# Altium schematic sheet Connector_Section.SchDoc
size A4; DocumentNumber: 5; SheetNumber: 5; SheetTotal: 5
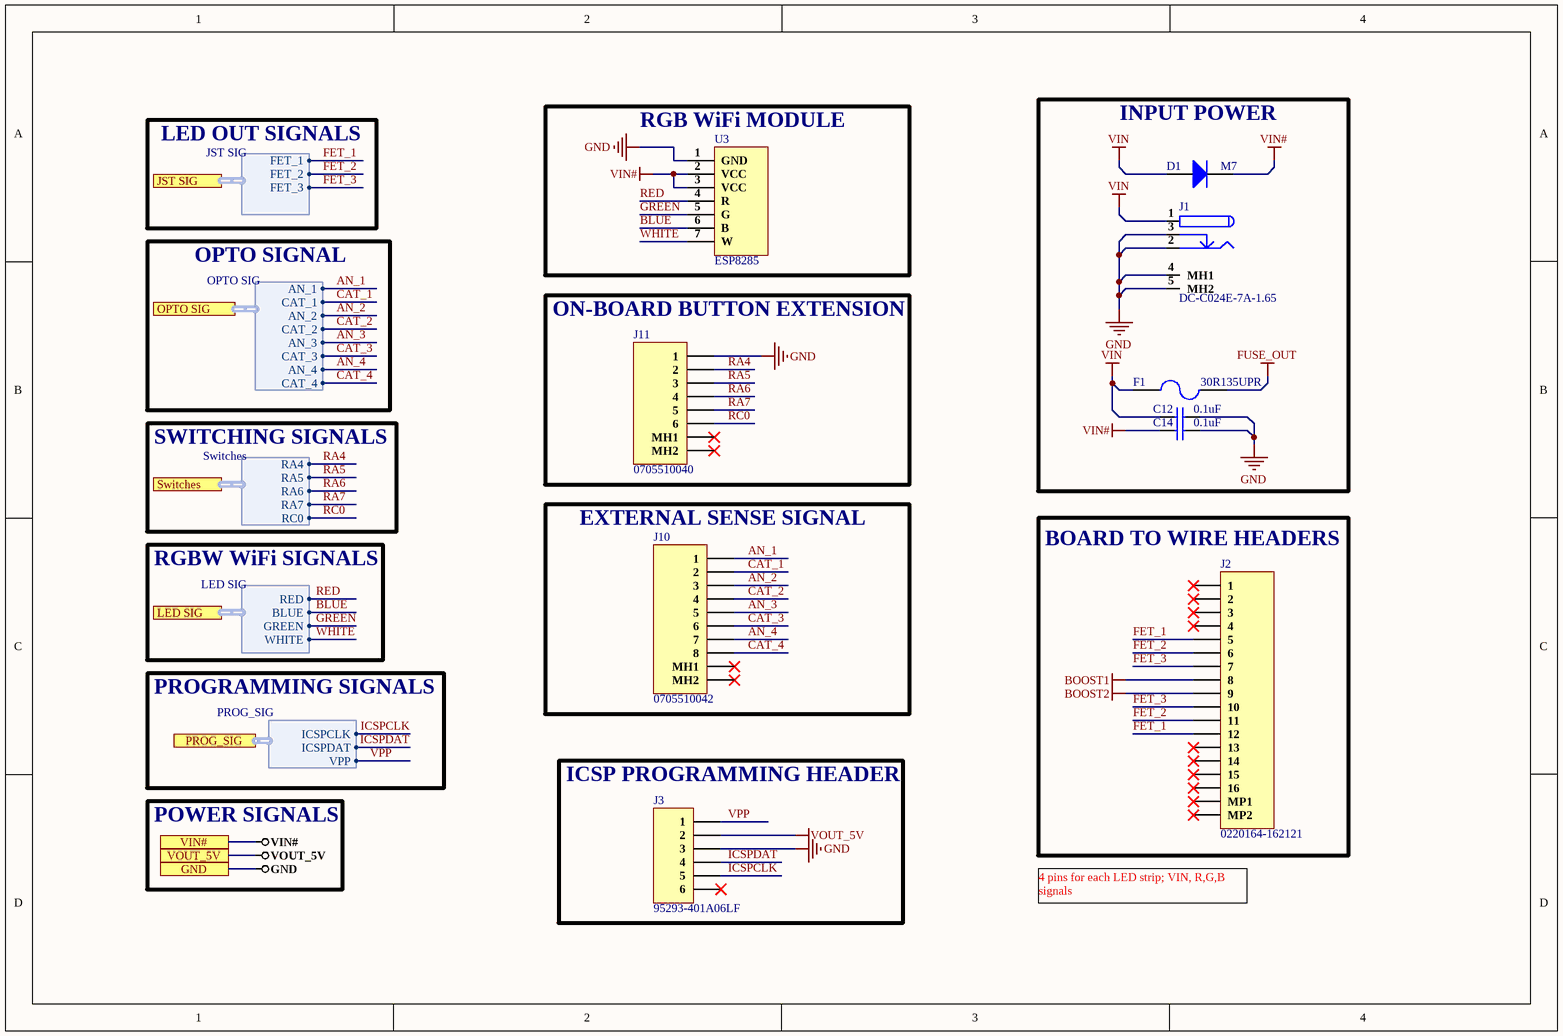
[diagram p0: Connector_Section.SchDoc]

## Parts
C12  0.1uF  [Cap0402]
C14  0.1uF  [Cap0402]
D1  M7  [SMA]
F1  30R135UPR  [30R135UPR]
J1  DC-C024E-7A-1.65  [DC-C024E-7A-1.65]
J2  0220164-162121  [0220164-162121]
J3  95293-401A06LF  [95293-401A06LF]
J10  0705510042  [0705510042]
J11  0705510040  [0705510040]
U3  ESP8285  [ESP8285]

## Blocks framed on the sheet
RGB WiFi MODULE: U3
INPUT POWER: C12 C14 D1 F1 J1
ON-BOARD BUTTON EXTENSION: J11
EXTERNAL SENSE SIGNAL: J10
BOARD TO WIRE HEADERS: J2
ICSP PROGRAMMING HEADER: J3

## Ports
GND, JST SIG (harness JST SIG), LED SIG (harness LED SIG), OPTO SIG (harness OPTO SIG), PROG_SIG (harness PROG_SIG), Switches (harness Switches), VIN#, VOUT_5V

## Harnesses
PROG_SIG: ICSPCLK, ICSPDAT, VPP
LED SIG: RED, BLUE, GREEN, WHITE
Switches: RA4, RA5, RA6, RA7, RC0
OPTO SIG: AN_1, CAT_1, AN_2, AN_3, AN_4, CAT_2, CAT_3, CAT_4
JST SIG: FET_1, FET_2, FET_3

## Nets
BOOST1: J2.8
BOOST2: J2.9
FUSE_OUT: F1.2
GND: C12.2 C14.2 J1.2 J1.3 J1.4(MH1) J1.5(MH2) J3.3 J11.1 U3.1(GND) ; port GND
VIN: C12.1 D1.1(A) F1.1 J1.1
VIN#: C14.1 D1.2(K) U3.2(VCC) U3.3(VCC) ; port VIN#
VOUT_5V: J3.2 ; port VOUT_5V
AN_1: J10.1 ; port OPTO SIG.AN_1
AN_2: J10.3 ; port OPTO SIG.AN_2
AN_3: J10.5 ; port OPTO SIG.AN_3
AN_4: J10.7 ; port OPTO SIG.AN_4
BLUE: U3.6(B) ; port LED SIG.BLUE
CAT_1: J10.2 ; port OPTO SIG.CAT_1
CAT_2: J10.4 ; port OPTO SIG.CAT_2
CAT_3: J10.6 ; port OPTO SIG.CAT_3
CAT_4: J10.8 ; port OPTO SIG.CAT_4
FET_1: J2.5 J2.12 ; port JST SIG.FET_1
FET_2: J2.6 J2.11 ; port JST SIG.FET_2
FET_3: J2.7 J2.10 ; port JST SIG.FET_3
GREEN: U3.5(G) ; port LED SIG.GREEN
ICSPCLK: J3.5 ; port PROG_SIG.ICSPCLK
ICSPDAT: J3.4 ; port PROG_SIG.ICSPDAT
RA4: J11.2 ; port Switches.RA4
RA5: J11.3 ; port Switches.RA5
RA6: J11.4 ; port Switches.RA6
RA7: J11.5 ; port Switches.RA7
RC0: J11.6 ; port Switches.RC0
RED: U3.4(R) ; port LED SIG.RED
VPP: J3.1 ; port PROG_SIG.VPP
WHITE: U3.7(W) ; port LED SIG.WHITE

Not connected (* = marked no-connect by the designer): J2 1* 2* 3* 4* 13* 14* 15* 16* MP1* MP2*; J3 6*; J10 MH1* MH2*; J11 MH1* MH2*

## Notes on the sheet
- LED OUT SIGNALS
- OPTO SIGNAL
- SWITCHING SIGNALS
- RGBW WiFi SIGNALS
- PROGRAMMING SIGNALS
- POWER SIGNALS
- 4 pins for each LED strip; VIN, R,G,B signals

## Library data of the parts
C12 C14 = C1005X5R1H104K050BB: CAP CER 0.1UF 50V X5R 0402; Manufacturer: TDK; Dielectric Material: Ceramic; Capacitance: 100nF; Tolerance: 10%; Supplier 1: Digi-Key; Manufacturer Part Number: C1005X5R1H104K050BB; Stock 1: 1455182; Pricing 1: 1=0.12, 10=0.09, 50=0.049, 100=0.04, 500=0.02858, 1000=0.02245, 2500=0.02041, 5000=0.01878 (USD); Mount: Surface Mount; Case/Package: 0402; Case Code (Metric): 1005; Case Code (Imperial): 0402; Weight: 2.3E-05oz; Min Operating Temperature: -55°C; Max Operating Temperature: 85°C; Dielectric: X5R; Voltage Rating: 50V; Packaging: Tape and Reel; Voltage Rating (DC): 50V; Termination: SMD/SMT; Construction: Flat; Package Quantity: 1; Resistor Type: Ceramic; Voltage: 50V; Series: C; Length: 1mm; Width: 0.02inch; Height: 0.5mm; Depth: 0.5mm; Thickness: 0.022inch; Radiation Hardening: No; Lead Free: Lead Free; REACH SVHC: No SVHC; RoHS Compliant: Yes; ComponentLink1URL: https://product.tdk.com/info/en/catalog/spec/mlccspec_commercial_general_midvoltage_en.pdf?src-supplier=Digi-Key; ComponentLink1Description: https://product.tdk.com/info/en/catalog/spec/mlccspec_commercial_general_midvoltage_en.pdf?src-supplier=Digi-Key; ComponentLink2URL: http://www.tdk.co.jp/tefe02/e413_c.pdf?src-supplier=Future+Electronics; ComponentLink2Description: http://www.tdk.co.jp/tefe02/e413_c.pdf?src-supplier=Future+Electronics; ComponentLink3URL: https://www.verical.com/server-webapp/html/getDatasheet?partID=743571&src-supplier=Verical; ComponentLink3Description: https://www.verical.com/server-webapp/html/getDatasheet?partID=743571&src-supplier=Verical; ComponentLink4URL: http://www.tdk.co.jp/tefe02/e412_c.pdf?src-supplier=Avnet+Europe; ComponentLink4Description: http://www.tdk.co.jp/tefe02/e412_c.pdf?src-supplier=Avnet+Europe; Supplier Part Number 1: 445-5942-1-ND
D1 = M7: 1A 5μA 1kV 1kV 1.1V 1A SMA(DO-214AC) Diodes - General Purpose ROHS; Manufacturer: Slkor; Value: Custom; Manufacturer Part No: M7; Package: SMA; ComponentLink1Description: LCSC; ComponentLink1URL: https://lcsc.com/product-detail/Diodes-General-Purpose_Slkor-SLKORMICRO-Elec-M7_C426571.html
F1 = 30R135UPR: PTC RESET FUSE 30V 1.35A RADIAL; Manufacturer: Littelfuse; Current Rating: 40A; Resistance: 130mR; Power Dissipation: 800mW; Trip Current: 2.7A; Time to Trip: 7.3s; Approvals: cULus,TUV; Supplier 1: Mouser; Manufacturer Part Number: 30R135UPR; RoHS: Yes; Category: PTC Resettable Fuses; Stock 1: 4973; Pricing 1: 1=0.53000, 10=0.42700, 50=0.42700, 100=0.32300, 1000=0.24200, 10000=0.23100 (USD); Case/Package: Radial; Min Operating Temperature: -40°C; Max Operating Temperature: 85°C; Package Quantity: 2000; Packaging: Tape and Reel; Max Current Rating: 40A; Termination: Radial; Max Voltage Rating (DC): 30V; Hold Current: 1.35A; Series: POLY-FUSE®, 30R; Width: 8.89mm; Height: 13.5mm; Lead Pitch: 5.1mm; Thickness: 3.05mm; Lead Free: Lead Free; RoHS Compliant: Yes; ComponentLink1URL: https://datasheet.ciiva.com/325/littelfuse-ptc-30r-325859.pdf?src-supplier=Digi-Key; ComponentLink1Description: https://datasheet.ciiva.com/325/littelfuse-ptc-30r-325859.pdf?src-supplier=Digi-Key; ComponentLink2URL: https://datasheet.ciiva.com/325/littelfuse-ptc-30r-325860.pdf?src-supplier=Digi-Key; ComponentLink2Description: https://datasheet.ciiva.com/325/littelfuse-ptc-30r-325860.pdf?src-supplier=Digi-Key; ComponentLink3URL: https://datasheet.ciiva.com/14119/gklittelfuse-30r-e-14119724.pdf?src-supplier=Distrelec; ComponentLink3Description: https://datasheet.ciiva.com/14119/gklittelfuse-30r-e-14119724.pdf?src-supplier=Distrelec; Supplier Part Number 1: 576-30R135UPR
J1 = DC-C024E-7A-1.65: DC Power Receptacle 1.65mm 4.3mm 7A 24V Plugin AC/DC Power Connectors ROHS; Manfacturer: XKB Connectivity; Maunfacturer Part No:: DC-C024E-7A-1.65; Package: Custom
J2 = 0220164-162121: 16 Pin Right angle JST Conn 2 mm Pitch; ComponentLink1Description: Datasheet; ComponentLink1URL: http://www.kaweei.com/indexdata/pic/2017072520595473499.pdf
J3 = 95293-401A06LF: CONN HEADER SMD 6POS 2.54MM; Manufacturer: Amphenol ICC / FCI; Number of Contacts: 6; Max Voltage Rating (AC): 1.5kV; Connector Type: Male Pin; Supplier 1: Digi-Key; Manufacturer Part Number: 95293-401A06LF; RoHS: Yes; Category: Headers and Wire Housings; Stock 1: 8979; Pricing 1: 1=3.32000, 10=3.01700, 100=2.65840 (USD); Mount: Surface Mount; Contact Plating: Tin; Color: Black; Contact Material: Bronze; Housing Color: Black; Housing Material: Thermoplastic; Min Operating Temperature: -65°C; Max Operating Temperature: 125°C; Number of Rows: 1; Termination: Solder; Package Quantity: 520; Packaging: Tape and Reel; Number of Positions: 6; Orientation: Straight; Series: BERGSTIK®, MezzSelect™, Basics+; Contact Type: Male Pin; Length: 15.24mm; Pitch: 2.54mm; Contact Mating Length: 0.23inch; Depth: 2.4mm; Radiation Hardening: No; Lead Free: Lead Free; RoHS Compliant: Yes; ComponentLink1URL: https://datasheet.ciiva.com/739/95293-739282.pdf?src-supplier=Digi-Key; ComponentLink1Description: https://datasheet.ciiva.com/739/95293-739282.pdf?src-supplier=Digi-Key; ComponentLink2URL: https://datasheet.ciiva.com/739/95293-739276.pdf?src-supplier=Digi-Key; ComponentLink2Description: https://datasheet.ciiva.com/739/95293-739276.pdf?src-supplier=Digi-Key; ComponentLink3URL: https://datasheet.ciiva.com/739/95293-739268.pdf?src-supplier=Digi-Key; ComponentLink3Description: https://datasheet.ciiva.com/739/95293-739268.pdf?src-supplier=Digi-Key; ComponentLink4URL: https://datasheet.ciiva.com/16733/95293-16733007.pdf?src-supplier=Avnet+Europe; ComponentLink4Description: https://datasheet.ciiva.com/16733/95293-16733007.pdf?src-supplier=Avnet+Europe; Supplier Part Number 1: 609-4398-1-ND
J10 = 0705510042: Conn Shrouded Header HDR 8 POS 2.54mm Solder RA Thru-Hole SL™ Tube; Manufacturer: Molex; Number of Positions: 8; Connector Type: Male Pin; Contact Resistance: 15mR; Pitch: 0.1inch; Supplier 1: Digi-Key; Manufacturer Part Number: 0705510042; RoHS: Yes; Category: Headers and Wire Housings; Pricing 1: 1=2.63000, 10=2.31400, 100=1.84100, 1000=1.52539, 5000=1.36759 (USD); Mount: Through Hole; Contact Plating: Gold; Color: Black; Housing Material: Polyester; Contact Material: Copper Alloy; Housing Color: Black; Min Operating Temperature: -40°C; Max Operating Temperature: 105°C; Number of Rows: 1; Packaging: Rail/Tube; Fastening Type: Latch; Termination: Solder; Orientation: Right Angle; Contact Mating Length: 0.24inch; Depth: 13.59mm; ComponentLink1URL: http://components.arrow.com/part/dataview/2934385S6164661N3303?src-supplier=Arrow+Electronics; ComponentLink1Description: http://components.arrow.com/part/dataview/2934385S6164661N3303?src-supplier=Arrow+Electronics; ComponentLink2URL: http://www.molex.com/pdm_docs/sd/705510001_sd.pdf?src-supplier=Digi-Key; ComponentLink2Description: http://www.molex.com/pdm_docs/sd/705510001_sd.pdf?src-supplier=Digi-Key; Supplier Part Number 1: WM20418-ND
J11 = 0705510040: CONN HEADER R/A 6POS 2.54MM; Manufacturer: Molex; Number of Positions: 6; Contact Resistance: 15mR; Connector Type: Male Pin; Supplier 1: Digi-Key; Manufacturer Part Number: 0705510040; RoHS: Yes; Category: Headers and Wire Housings; Stock 1: 1707; Pricing 1: 1=2.52000, 28=2.14929, 84=1.77560, 952=1.40175, 4900=1.24600 (USD); Mount: Through Hole; Contact Plating: Gold; Color: Black; Contact Material: Copper Alloy; Housing Material: Polyester; Housing Color: Black; Min Operating Temperature: -40°C; Max Operating Temperature: 105°C; Number of Rows: 1; Packaging: Rail/Tube; Termination: Solder; Number of Contacts: 6; Package Quantity: 1120; Fastening Type: Latch; Orientation: Right Angle; Pitch: 2.54mm; Contact Mating Length: 0.24inch; Depth: 13.59mm; Radiation Hardening: No; ComponentLink1URL: http://components.arrow.com/part/dataview/2934387S8722778N3303?src-supplier=Arrow+Electronics; ComponentLink1Description: http://components.arrow.com/part/dataview/2934387S8722778N3303?src-supplier=Arrow+Electronics; ComponentLink2URL: https://www.molex.com/pdm_docs/sd/705510001_sd.pdf?src-supplier=Digi-Key; ComponentLink2Description: https://www.molex.com/pdm_docs/sd/705510001_sd.pdf?src-supplier=Digi-Key; Supplier Part Number 1: WM21002-ND
U3 = ESP8285: DC5-24V Wireless WIFI LED RGB Controller RGBW Controller IR / RF Remote Control IOS/Android for LED Strip RGB RGBW RGBWW; Manufacturer: Tasmota; ComponentLink1Description: Supplier Link; ComponentLink1URL: https://tasmota.github.io/docs/devices/MagicHome-with-ESP8285/#; Manufacturer Part No: ESP8285; Package: Custom